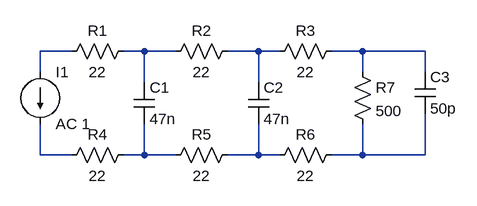
[diagram p0: schematic filtro_cry_conCR.asc]
filtro_cry_conCR.asc, the LTspice schematic file:
Version 4.1
SHEET 1 1204 680
WIRE -48 80 -96 80
WIRE 64 80 32 80
WIRE 112 80 64 80
WIRE 240 80 192 80
WIRE 272 80 240 80
WIRE 400 80 352 80
WIRE 496 80 400 80
WIRE -96 112 -96 80
WIRE 400 112 400 80
WIRE 496 112 496 80
WIRE 64 128 64 80
WIRE 240 128 240 80
WIRE -96 240 -96 192
WIRE -48 240 -96 240
WIRE 64 240 64 192
WIRE 64 240 32 240
WIRE 112 240 64 240
WIRE 240 240 240 192
WIRE 240 240 192 240
WIRE 272 240 240 240
WIRE 400 240 400 192
WIRE 400 240 352 240
WIRE 496 240 496 176
WIRE 496 240 400 240
SYMBOL res 48 64 R90
WINDOW 0 0 56 VBottom 2
WINDOW 3 32 56 VTop 2
SYMATTR InstName R1
SYMATTR Value 22
SYMBOL res 208 64 R90
WINDOW 0 0 56 VBottom 2
WINDOW 3 32 56 VTop 2
SYMATTR InstName R2
SYMATTR Value 22
SYMBOL res 368 64 R90
WINDOW 0 0 56 VBottom 2
WINDOW 3 32 56 VTop 2
SYMATTR InstName R3
SYMATTR Value 22
SYMBOL res 48 224 R90
WINDOW 0 0 56 VBottom 2
WINDOW 3 32 56 VTop 2
SYMATTR InstName R4
SYMATTR Value 22
SYMBOL res 208 224 R90
WINDOW 0 0 56 VBottom 2
WINDOW 3 32 56 VTop 2
SYMATTR InstName R5
SYMATTR Value 22
SYMBOL res 368 224 R90
WINDOW 0 0 56 VBottom 2
WINDOW 3 32 56 VTop 2
SYMATTR InstName R6
SYMATTR Value 22
SYMBOL cap 48 128 R0
SYMATTR InstName C1
SYMATTR Value 47n
SYMBOL cap 224 128 R0
SYMATTR InstName C2
SYMATTR Value 47n
SYMBOL res 384 96 R0
SYMATTR InstName R7
SYMATTR Value 500
SYMBOL cap 480 112 R0
SYMATTR InstName C3
SYMATTR Value 50p
SYMBOL current -96 112 R0
WINDOW 123 0 0 Left 0
WINDOW 39 0 0 Left 0
SYMATTR InstName I1
SYMATTR Value AC 1

The netlist it stands for:
* filtro_cry_conCR.asc
R1 N002 N001 22
R2 N003 N002 22
R3 N004 N003 22
R4 N006 N005 22
R5 N007 N006 22
R6 N008 N007 22
C1 N002 N006 47n
C2 N003 N007 47n
R7 N004 N008 500
C3 N004 N008 50p
I1 N001 N005 AC 1
.backanno
.end